# Altium schematic sheet Top-Sheet.SchDoc
size A4; SheetNumber: 1
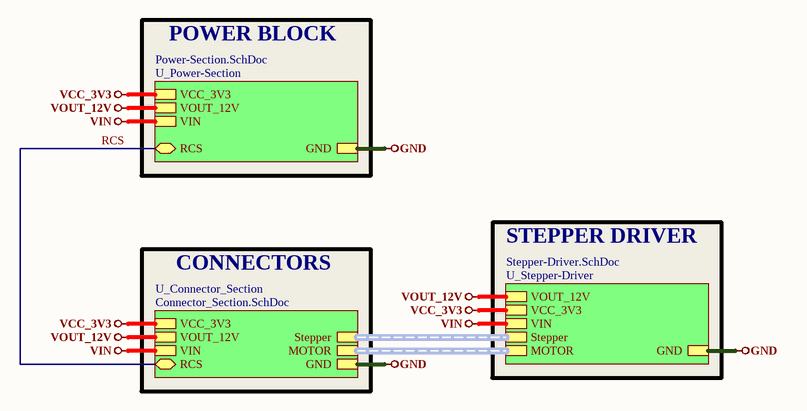
[diagram p0: Top-Sheet.SchDoc]

## Sub-sheets
U_Connector_Section = Connector_Section.SchDoc: GND, VCC_3V3, VOUT_12V, RCS (bidir), Stepper (harness Stepper), VIN, MOTOR (harness MOTOR)
U_Power-Section = Power-Section.SchDoc: VCC_3V3, GND, VOUT_12V, VIN, RCS (bidir)
U_Stepper-Driver = Stepper-Driver.SchDoc: Stepper (harness Stepper), MOTOR (harness MOTOR), VOUT_12V, GND, VCC_3V3, VIN

## Nets
GND: sheet U_Power-Section/GND, sheet U_Stepper-Driver/GND, sheet U_Connector_Section/GND
VCC_3V3: sheet U_Power-Section/VCC_3V3, sheet U_Stepper-Driver/VCC_3V3, sheet U_Connector_Section/VCC_3V3
VIN: sheet U_Power-Section/VIN, sheet U_Stepper-Driver/VIN, sheet U_Connector_Section/VIN
VOUT_12V: sheet U_Power-Section/VOUT_12V, sheet U_Stepper-Driver/VOUT_12V, sheet U_Connector_Section/VOUT_12V
RCS: sheet U_Power-Section/RCS, sheet U_Connector_Section/RCS

## Buses and harness runs
harness sheet U_Connector_Section/MOTOR = sheet U_Stepper-Driver/MOTOR
harness sheet U_Connector_Section/Stepper = sheet U_Stepper-Driver/Stepper

## Notes on the sheet
- POWER BLOCK
- CONNECTORS
- STEPPER DRIVER